# Altium schematic sheet Main.SchDoc
size A4
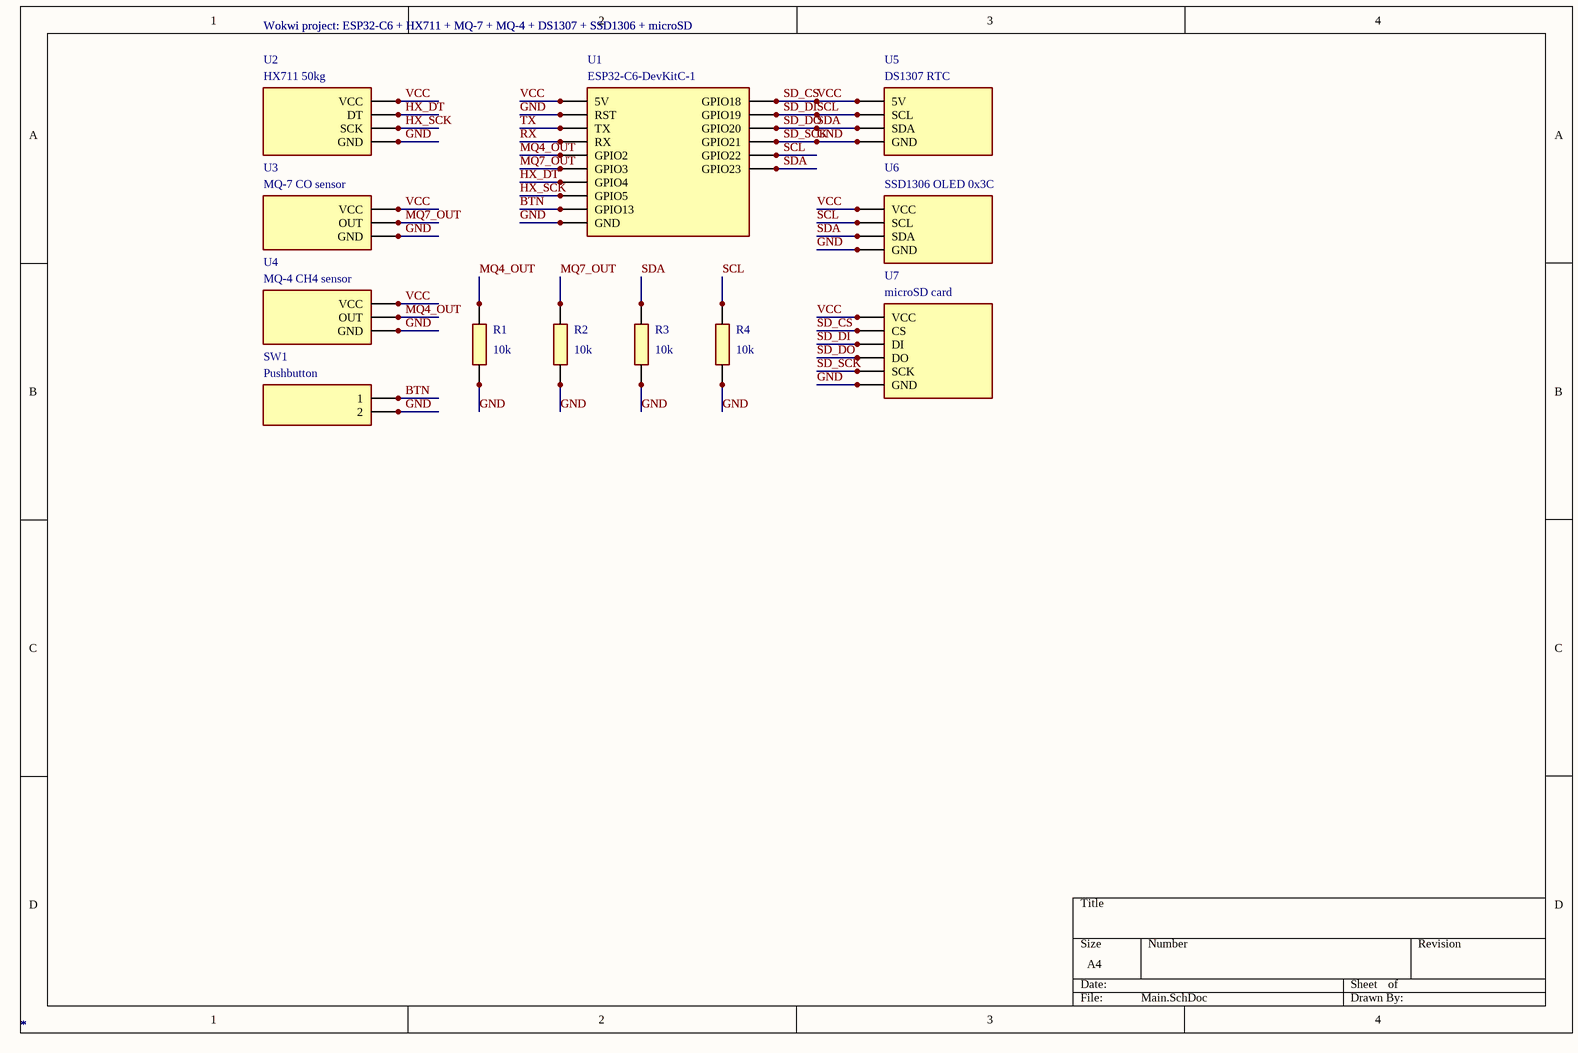
[diagram p0: Main.SchDoc]

## Parts
(Parts that share a designator on the sheet are numbered #1, #2 ... from top to bottom, then left to right.)
*#1  *
*#2  *
*#3  *
*#4  *
*#5  *
*#6  *
*#7  *
*#8  *
*#9  *
*#10  *
*#11  *
*#12  *
R1  10k
R2  10k
R3  10k
R4  10k
SW1  Pushbutton
U1  ESP32-C6-DevKitC-1
U2  HX711 50kg
U3  MQ-7 CO sensor
U4  MQ-4 CH4 sensor
U5  DS1307 RTC
U6  SSD1306 OLED 0x3C
U7  microSD card

## Nets
BTN: SW1.1 U1.9(GPIO13)
GND: R1.2 R2.2 R3.2 R4.2 SW1.2 U1.2(RST) U1.10(GND) U1.14(GPIO21) U2.4(GND) U3.3(GND) U4.3(GND) U5.4(GND) U6.4(GND) U7.5(SCK) U7.6(GND)  [also labelled SD_SCK]
HX_DT: U1.7(GPIO4) U2.2(DT)
HX_SCK: U1.8(GPIO5) U2.3(SCK)
MQ4_OUT: R1.1 U1.5(GPIO2) U4.2(OUT)
MQ7_OUT: R2.1 U1.6(GPIO3) U3.2(OUT)
RX: U1.4(RX)
SCL: R4.1 U1.12(GPIO19) U1.15(GPIO22) U5.2(SCL) U6.2(SCL) U7.3(DI)  [also labelled SD_DI]
SD_CS: U1.1(5V) U1.11(GPIO18) U2.1(VCC) U3.1(VCC) U4.1(VCC) U5.1(5V) U6.1(VCC) U7.1(VCC) U7.2(CS)  [also labelled VCC]
SD_DO: R3.1 U1.13(GPIO20) U1.16(GPIO23) U5.3(SDA) U6.3(SDA) U7.4(DO)  [also labelled SDA]
TX: U1.3(TX)

## Notes on the sheet
- Wokwi project: ESP32-C6 + HX711 + MQ-7 + MQ-4 + DS1307 + SSD1306 + microSD

## Library data of the parts
*#1 = *: HX711 50kg
*#2 = *: ESP32-C6-DevKitC-1
*#3 = *: DS1307 RTC
*#4 = *: MQ-7 CO sensor
*#5 = *: SSD1306 OLED 0x3C
*#6 = *: MQ-4 CH4 sensor
*#7-*#10 R1-R4 = *: Resistor
*#11 = *: microSD card
*#12 = *: Pushbutton
SW1 U1-U7 = *